# Altium schematic sheet IMU.SchDoc
size A; SheetNumber: 7; SheetTotal: 8
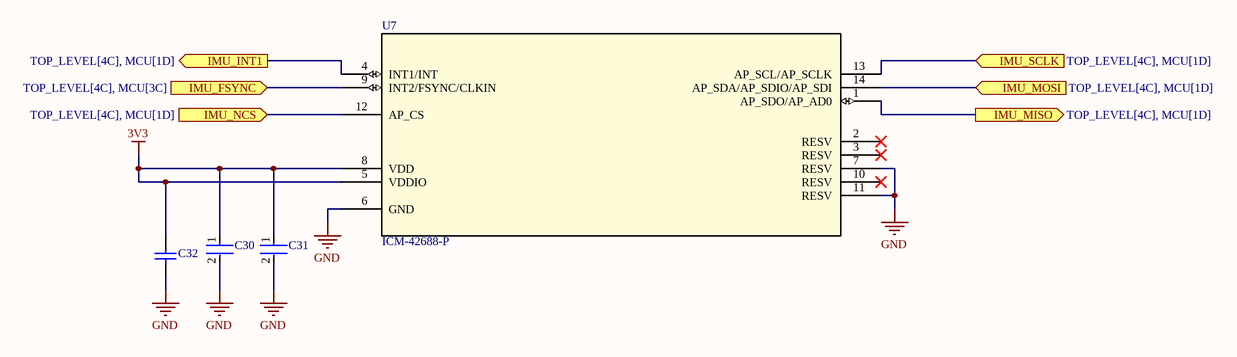
[diagram p0: IMU.SchDoc]

## Parts
C30  GRM21BD72A225ME01K  [FP-GRM21B-0_2-e0_2_0_7-IPC_B]  (value not drawn)
C31  CL21B104KBCNNNC  [FP-CL21-IPC_C]  (value not drawn)
C32  CL21B103KBANNNC  [CAPC2013X75X45LL10T25]  (value not drawn)
U7  ICM-42688-P  [LGA14_2P5X3X0P91_TDK]

## Ports
IMU_FSYNC (in, see TOP_LEVEL[4C], MCU[3C]), IMU_INT1 (out, see TOP_LEVEL[4C], MCU[1D]), IMU_MISO (out, see TOP_LEVEL[4C], MCU[1D]), IMU_MOSI (in, see TOP_LEVEL[4C], MCU[1D]), IMU_NCS (in, see TOP_LEVEL[4C], MCU[1D]), IMU_SCLK (in, see TOP_LEVEL[4C], MCU[1D])

## Nets
3V3: C30.1 C31.1 C32.2 U7.5(VDDIO) U7.8(VDD)
GND: C30.2 C31.2 C32.1 U7.6(GND) U7.7(RESV) U7.11(RESV)
IMU_FSYNC: U7.9(INT2/FSYNC/CLKIN) ; port IMU_FSYNC
IMU_INT1: U7.4(INT1/INT) ; port IMU_INT1
IMU_MISO: U7.1(AP_SDO/AP_AD0) ; port IMU_MISO
IMU_MOSI: U7.14(AP_SDA/AP_SDIO/AP_SDI) ; port IMU_MOSI
IMU_NCS: U7.12(AP_CS) ; port IMU_NCS
IMU_SCLK: U7.13(AP_SCL/AP_SCLK) ; port IMU_SCLK

Not connected (* = marked no-connect by the designer): U7 2(RESV)* 3(RESV)* 10(RESV)*

## Library data of the parts
C30 = CMP-06035-063309-1: CAP CER 2.2UF 100V X7T 0805
C31 = CMP-2000-05017-2: CL21 Series 0805 100nF 50V ±10% Tolerance X7R Multilayer Ceramic Chip Capacitor; Depth: 1.25mm; Height: 0.85mm; Width: 0.049inch; Tolerance: 10%; Case Code (Metric): 2012; Case Code (Imperial): 0805; Material: Ceramic; Thickness: 0.037inch; Min Operating Temperature: -55°C; Contact Plating: Tin; Length: 2mm; Mount: Surface Mount; Voltage Rating (DC): 50V; Lead Free: Lead Free; Dielectric: X7R; Radiation Hardening: No; Capacitance: 100nF; Voltage Rating: 50V; Case/Package: 0805; Packaging: Tape and Reel; Max Operating Temperature: 125°C; Voltage: 50V
C32 = CMP-2000-06105-1: Multilayer Ceramic Capacitor, 10 nF, 50 V, -55 to 125 degC, 2-Pin SMD, RoHS, Tape and Reel; Manufacturer: Samsung Electro-Mechanics; Capacitance: 10000pF; Tolerance (%): ±10%; Dielectric: X7R; Rated Voltage: 50V; Package Description: 2-Pin Surface Mount Device, Body 2 x 1.25 mm; Datasheet Version: 11/2010; Package Reference: 0805; Case Size/Dimension: 0805; Datasheet URL: https://datasheet.ciiva.com/29199/455082-da-01-en-vs-kondensator-0805-29199459.pdf; Mounting Technology: SurfaceMount; Manufacturer URL: http://www.samsungsem.com/global/index.jsp
U7 = ICM-42688-P: Description; Manufacturer_Name: TDK; Type: Motion Sensors; Copyright: Copyright (C) 2025 Ultra Librarian. All rights reserved.; Manufacturer_Part_Number: ICM-42688-P; RefDes: RefDes